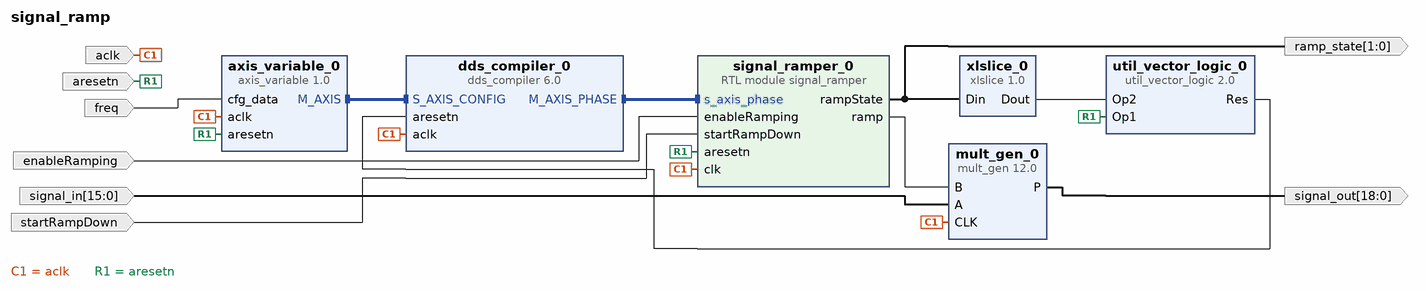
[diagram p0: block diagram of the top level]
# Vivado block design signal_ramp, xc7z010clg400-1, Vivado 2021.2
create_bd_design signal_ramp

create_bd_port -dir I -type clk aclk
set_property -dict {CONFIG.ASSOCIATED_RESET aresetn CONFIG.FREQ_HZ 125000000} [get_bd_ports aclk]
create_bd_port -dir I -type rst aresetn
create_bd_port -dir I enableRamping
create_bd_port -dir I -type data freq
create_bd_port -dir O -from 1 -to 0 ramp_state
create_bd_port -dir I -from 15 -to 0 -type data signal_in
create_bd_port -dir O -from 18 -to 0 -type data signal_out
create_bd_port -dir I startRampDown

create_bd_cell -type ip -vlnv pavel-demin:user:axis_variable:1.0 axis_variable_0
set_property -dict {CONFIG.AXIS_TDATA_WIDTH 48} [get_bd_cells axis_variable_0]
create_bd_cell -type ip -vlnv xilinx.com:ip:dds_compiler:6.0 dds_compiler_0
set_property -dict [list \
  CONFIG.DATA_Has_TLAST Not_Required \
  CONFIG.DDS_Clock_Rate 125 \
  CONFIG.Frequency_Resolution 0.4 \
  CONFIG.Has_ARESETn true \
  CONFIG.Has_Phase_Out true \
  CONFIG.Has_TREADY false \
  CONFIG.Latency 1 \
  CONFIG.M_DATA_Has_TUSER Not_Required \
  CONFIG.Noise_Shaping None \
  CONFIG.Output_Frequency1 0 \
  CONFIG.Output_Width 3 \
  CONFIG.PINC1 0 \
  CONFIG.Parameter_Entry Hardware_Parameters \
  CONFIG.PartsPresent Phase_Generator_only \
  CONFIG.Phase_Increment Programmable \
  CONFIG.Phase_Width 48 \
  CONFIG.Phase_offset None \
  CONFIG.S_PHASE_Has_TUSER Not_Required \
] [get_bd_cells dds_compiler_0]
create_bd_cell -type ip -vlnv xilinx.com:ip:mult_gen:12.0 mult_gen_0
set_property -dict [list \
  CONFIG.Multiplier_Construction Use_Mults \
  CONFIG.OptGoal Speed \
  CONFIG.OutputWidthHigh 31 \
  CONFIG.OutputWidthLow 13 \
  CONFIG.PipeStages 3 \
  CONFIG.PortAType Signed \
  CONFIG.PortAWidth 19 \
  CONFIG.PortBType Signed \
  CONFIG.PortBWidth 16 \
  CONFIG.Use_Custom_Output_Width true \
] [get_bd_cells mult_gen_0]
create_bd_cell -type module -reference signal_ramper signal_ramper_0
create_bd_cell -type ip -vlnv xilinx.com:ip:util_vector_logic:2.0 util_vector_logic_0
set_property -dict {CONFIG.C_SIZE 1} [get_bd_cells util_vector_logic_0]
create_bd_cell -type ip -vlnv xilinx.com:ip:xlslice:1.0 xlslice_0
set_property -dict {CONFIG.DIN_FROM 1 CONFIG.DIN_TO 1 CONFIG.DIN_WIDTH 2 CONFIG.DOUT_WIDTH 1} [get_bd_cells xlslice_0]

# ---- connections ----

connect_bd_intf_net [get_bd_intf_pins axis_variable_0/M_AXIS] [get_bd_intf_pins dds_compiler_0/S_AXIS_CONFIG]
connect_bd_intf_net [get_bd_intf_pins dds_compiler_0/M_AXIS_PHASE] [get_bd_intf_pins signal_ramper_0/s_axis_phase]
connect_bd_net [get_bd_ports aclk] \
  [get_bd_pins axis_variable_0/aclk] [get_bd_pins dds_compiler_0/aclk] [get_bd_pins mult_gen_0/CLK] \
  [get_bd_pins signal_ramper_0/clk]
connect_bd_net [get_bd_ports aresetn] \
  [get_bd_pins axis_variable_0/aresetn] [get_bd_pins signal_ramper_0/aresetn] [get_bd_pins util_vector_logic_0/Op1]
connect_bd_net [get_bd_ports enableRamping] [get_bd_pins signal_ramper_0/enableRamping]
connect_bd_net [get_bd_ports freq] [get_bd_pins axis_variable_0/cfg_data]
connect_bd_net [get_bd_ports signal_in] [get_bd_pins mult_gen_0/A]
connect_bd_net [get_bd_pins signal_ramper_0/ramp] [get_bd_pins mult_gen_0/B]
connect_bd_net -net signal_ramper_0_rampState [get_bd_pins mult_gen_0/P] [get_bd_ports signal_out]
connect_bd_net [get_bd_pins signal_ramper_0/rampState] [get_bd_ports ramp_state] [get_bd_pins xlslice_0/Din]
connect_bd_net [get_bd_ports startRampDown] [get_bd_pins signal_ramper_0/startRampDown]
connect_bd_net [get_bd_pins util_vector_logic_0/Res] [get_bd_pins dds_compiler_0/aresetn]
connect_bd_net [get_bd_pins xlslice_0/Dout] [get_bd_pins util_vector_logic_0/Op2]

validate_bd_design
save_bd_design
